# Altium schematic sheet HMS.SIM.A7677S.SchDoc
size A2
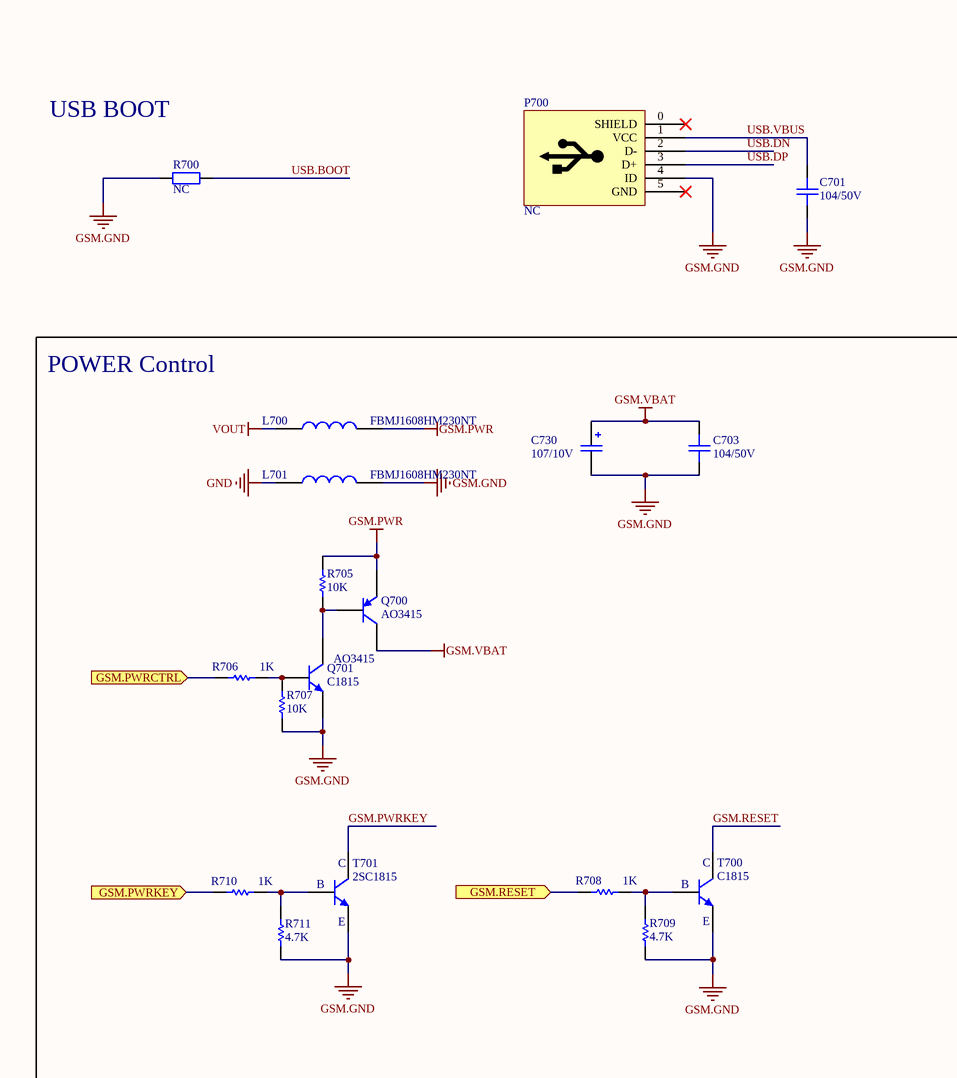
[diagram p0: HMS.SIM.A7677S.SchDoc, left]
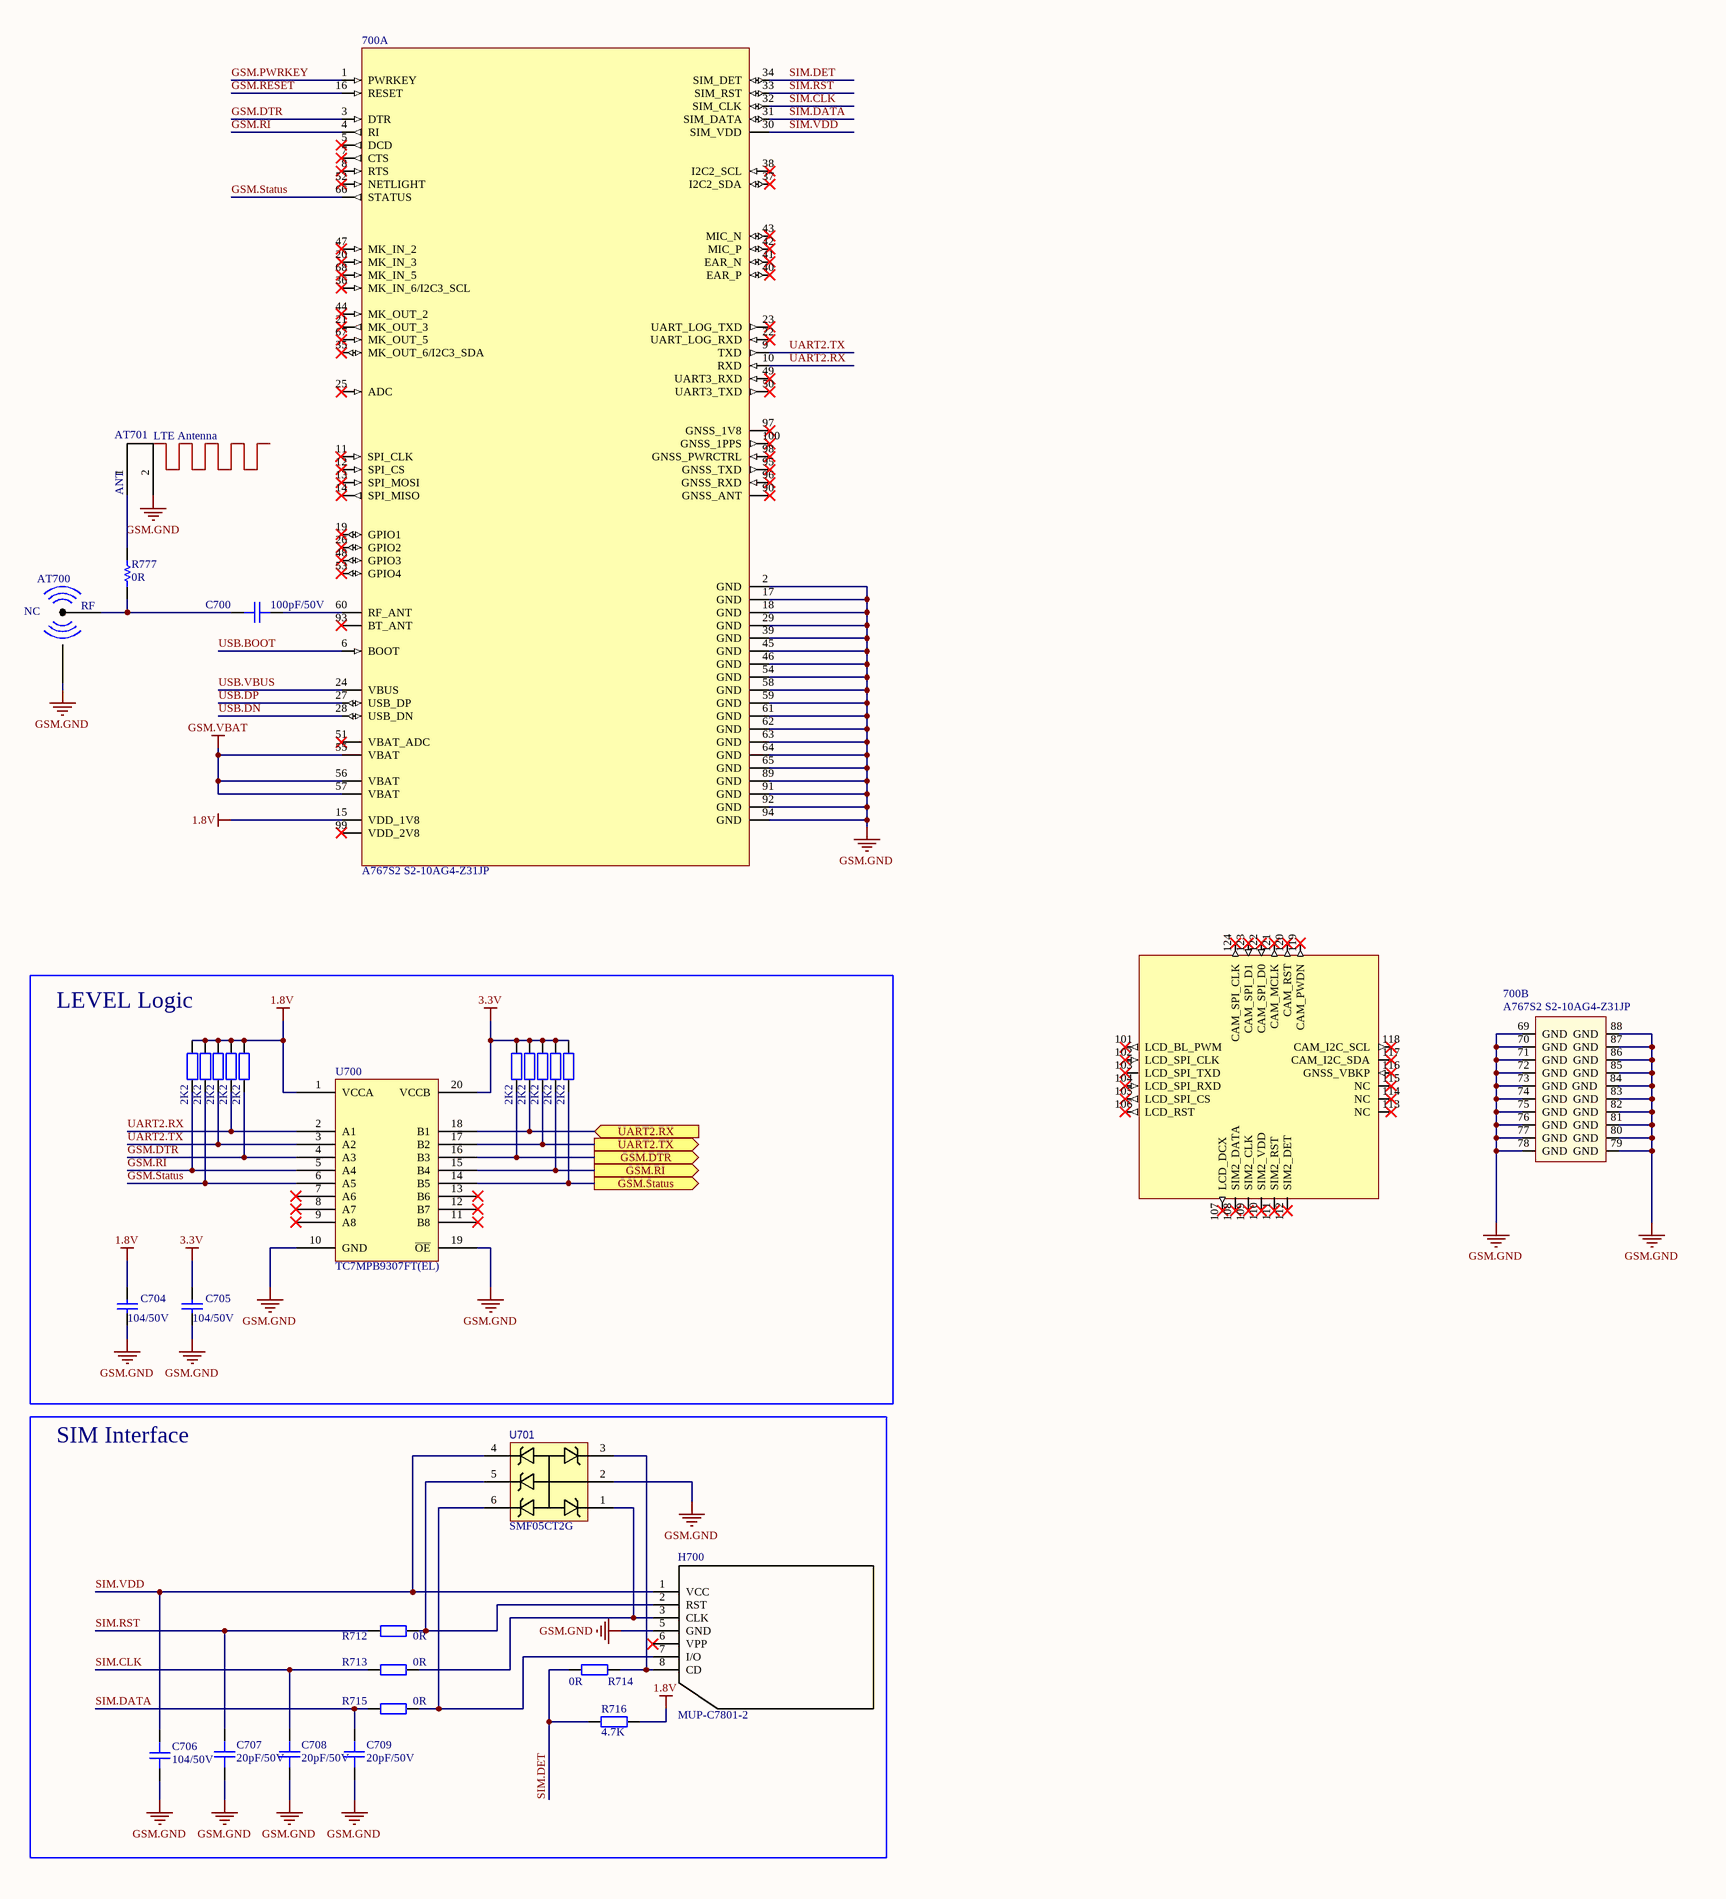
[diagram p1: HMS.SIM.A7677S.SchDoc, right]

## Parts
700  A767S2 S2-10AG4-Z31JP  [SIM_A7672]  (parts A,B of 2)
AT700  NC  [IPEX SMD]
AT701  LTE Antenna  [Antenna LTE/4G PCB]
C700  100pF/50V  [CAP_CERAMIC_0402(1005)]
C701  104/50V  [CAP_CERAMIC_0402(1005)]
C703  104/50V  [CAP_CERAMIC_0402(1005)]
C704  104/50V  [CAP_CERAMIC_0402(1005)]
C705  104/50V  [CAP_CERAMIC_0402(1005)]
C706  104/50V  [CAP_CERAMIC_0402(1005)]
C707  20pF/50V  [CAP_CERAMIC_0402(1005)]
C708  20pF/50V  [CAP_CERAMIC_0402(1005)]
C709  20pF/50V  [CAP_CERAMIC_0402(1005)]
C730  107/10V  [CAP_TANTAL_2312(6032-28)]
H700  MUP-C7801-2  [MUP-C7801]
L700  FBMJ1608HM230NT  [Inductor_0603]
L701  FBMJ1608HM230NT  [Inductor_0603]
P700  NC  [HDR1X4]
Q700  AO3415  [SOT23-3]
Q701  C1815  [SOT23-3]
R700  NC  [RES_0402(1005)]
R701  2K2  [RES_0402(1005)]
R702  2K2  [RES_0402(1005)]
R703  2K2  [RES_0402(1005)]
R704  2K2  [RES_0402(1005)]
R705  10K  [RES_0402(1005)]
R706  1K  [RES_0402(1005)]
R707  10K  [RES_0402(1005)]
R708  1K  [RES_0402(1005)]
R709  4.7K  [RES_0402(1005)]
R710  1K  [RES_0402(1005)]
R711  4.7K  [RES_0402(1005)]
R712  0R  [RES_0402(1005)]
R713  0R  [RES_0402(1005)]
R714  0R  [RES_0402(1005)]
R715  0R  [RES_0402(1005)]
R716  4.7K  [RES_0402(1005)]
R717  2K2  [RES_0402(1005)]
R718  2K2  [RES_0402(1005)]
R719  2K2  [RES_0402(1005)]
R720  2K2  [RES_0402(1005)]
R721  2K2  [RES_0402(1005)]
R722  2K2  [RES_0402(1005)]
R777  value 0R  [RES_0402(1005)]  (hidden comment: NC)
T700  C1815  [SOT23-3]
T701  2SC1815  [SOT23-3]
U700  TC7MPB9307FT(EL)  [TSOP65P640X120-20N]
U701  SMF05CT2G  [SOT65P210X140-6N]

## Blocks framed on the sheet
POWER Control: C703 C730 L700 L701 Q700 Q701 R705-R711 T700 T701
LEVEL Logic: C704 C705 R701-R704 R717-R722 U700
SIM Interface: C706-C709 H700 R712-R716 U701

## Ports
GSM.DTR (out), GSM.PWRCTRL (in), GSM.PWRKEY (in), GSM.RESET (in), GSM.RI (out), GSM.Status (out), UART2.RX (in), UART2.TX (out)

## Nets
1.8V: 700.15(VDD_1V8) C704.2 R701.2 R702.2 R716.2 R717.2 R718.2 R719.2 U700.1(VCCA)
3.3V: C705.2 R703.2 R704.2 R720.2 R721.2 R722.2 U700.20(VCCB)
GND: L701.1
GSM.GND: 700.2(GND) 700.17(GND) 700.18(GND) 700.29(GND) 700.39(GND) 700.45(GND) 700.46(GND) 700.54(GND) 700.58(GND) 700.59(GND) 700.61(GND) 700.62(GND) 700.63(GND) 700.64(GND) 700.65(GND) 700.69(GND) 700.70(GND) 700.71(GND) 700.72(GND) 700.73(GND) 700.74(GND) 700.75(GND) 700.76(GND) 700.77(GND) 700.78(GND) 700.79(GND) 700.80(GND) 700.81(GND) 700.82(GND) 700.83(GND) 700.84(GND) 700.85(GND) 700.86(GND) 700.87(GND) 700.88(GND) 700.89(GND) 700.91(GND) 700.92(GND) 700.94(GND) AT700.2 AT701.2 C701.2 C703.1 C704.1 C705.1 C706.1 C707.1 C708.1 C709.1 C730.2 H700.5(GND) L701.2 P700.4(ID) Q701.2(E) R700.1 R707.1 R709.2 R711.2 T700.2 T701.2 U700.10(GND) U700.19(~{OE}) U701.2(AN)
GSM.PWR: L700.2 Q700.2(E) R705.2
GSM.VBAT: 700.55(VBAT) 700.56(VBAT) 700.57(VBAT) C703.2 C730.1 Q700.3(C)
VOUT: L700.1
GSM.DTR: 700.3(DTR) R719.1 U700.4(A3)
GSM.DTR: R720.1 U700.16(B3) ; port GSM.DTR  [a separate net that carries the same name]
GSM.PWRCTRL: R706.2 ; port GSM.PWRCTRL
GSM.PWRKEY: 700.1(PWRKEY) T701.3
GSM.PWRKEY: R710.2 ; port GSM.PWRKEY  [a separate net that carries the same name]
GSM.RESET: 700.16(RESET) T700.3
GSM.RESET: R708.2 ; port GSM.RESET  [a separate net that carries the same name]
GSM.RI: 700.4(RI) R717.1 U700.5(A4)
GSM.RI: R721.1 U700.15(B4) ; port GSM.RI  [a separate net that carries the same name]
GSM.Status: 700.66(STATUS) R718.1 U700.6(A5)
GSM.Status: R722.1 U700.14(B5) ; port GSM.Status  [a separate net that carries the same name]
SIM.CLK: 700.32(SIM_CLK) C708.2 R713.1
SIM.DATA: 700.31(SIM_DATA) C709.2 R715.1
SIM.DET: 700.34(SIM_DET) R714.1 R716.1
SIM.RST: 700.33(SIM_RST) C707.2 R712.1
SIM.VDD: 700.30(SIM_VDD) C706.2 H700.1(VCC) U701.4(CT3)
UART2.RX: 700.10(RXD) R702.1 U700.2(A1)
UART2.RX: R703.1 U700.18(B1) ; port UART2.RX  [a separate net that carries the same name]
UART2.TX: 700.9(TXD) R701.1 U700.3(A2)
UART2.TX: R704.1 U700.17(B2) ; port UART2.TX  [a separate net that carries the same name]
USB.BOOT: 700.6(BOOT) R700.2
USB.DN: 700.28(USB_DN) P700.2(D-)
USB.DP: 700.27(USB_DP) P700.3(D+)
USB.VBUS: 700.24(VBUS) C701.1 P700.1(VCC)
Net700_60: 700.60(RF_ANT) C700.2
NetAT700_1: AT700.1 C700.1 R777.2
NetAT701_1: AT701.1 R777.1
NetH700_2: H700.2(RST) R712.2 U701.5(CT4)
NetH700_3: H700.3(CLK) R713.2 U701.1(CT1)
NetH700_7: H700.7(I/O) R715.2 U701.6(CT5)
NetH700_8: H700.8(CD) R714.2 U701.3(CT2)
NetQ700_1: Q700.1(B) Q701.3(C) R705.1
NetQ701_1: Q701.1(B) R706.1 R707.2
NetR708_1: R708.1 R709.1 T700.1
NetR710_1: R710.1 R711.1 T701.1

Not connected (* = marked no-connect by the designer): 700 5(DCD)* 7(CTS)* 8(RTS)* 11(SPI_CLK)* 12(SPI_CS)* 13(SPI_MOSI)* 14(SPI_MISO)* 19(GPIO1)* 20(MK_IN_3)* 21(MK_OUT_3)* 22(UART_LOG_RXD)* 23(UART_LOG_TXD)* 25(ADC)* 26(GPIO2)* 35(MK_OUT_6/I2C3_SDA)* 36(MK_IN_6/I2C3_SCL)* 37(I2C2_SDA)* 38(I2C2_SCL)* 40(EAR_P)* 41(EAR_N)* 42(MIC_P)* 43(MIC_N)* 44(MK_OUT_2)* 47(MK_IN_2)* 48(GPIO3)* 49(UART3_RXD)* 50(UART3_TXD)* 51(VBAT_ADC)* 52(NETLIGHT)* 53(GPIO4)* 67(MK_OUT_5)* 68(MK_IN_5)* 90(GNSS_ANT)* 93(BT_ANT)* 95(GNSS_TXD)* 96(GNSS_RXD)* 97(GNSS_1V8)* 98(GNSS_PWRCTRL)* 99(VDD_2V8)* 100(GNSS_1PPS)* 101(LCD_BL_PWM)* 102(LCD_SPI_CLK)* 103(LCD_SPI_TXD)* 104(LCD_SPI_RXD)* 105(LCD_SPI_CS)* 106(LCD_RST)* 107(LCD_DCX)* 108(SIM2_DATA)* 109(SIM2_CLK)* 110(SIM2_VDD)* 111(SIM2_RST)* 112(SIM2_DET)* 113(NC)* 114(NC)* 115(NC)* 116(GNSS_VBKP)* 117(CAM_I2C_SDA)* 118(CAM_I2C_SCL)* 119(CAM_PWDN)* 120(CAM_RST)* 121(CAM_MCLK)* 122(CAM_SPI_D0)* 123(CAM_SPI_D1)* 124(CAM_SPI_CLK)*; H700 6(VPP)*; P700 0(SHIELD)* 5(GND)*; U700 7(A6)* 8(A7)* 9(A8)* 11(B8)* 12(B7)* 13(B6)*

## Notes on the sheet
- USB BOOT
- (in symbol 2SC1815-HF) C; B; E
- (in symbol Antenna GSM/LTE PCB) ANT
- (in symbol IPEX-AT) RF

## Library data of the parts
700 = SIM_A7672: MPN: A767S2 S2-10AG4-Z31JP; Value: A767S2 S2-10AG4-Z31JP
AT700 = IPEX-AT: IPEX SMD; MPN: U.FL-R-SMT-1(80); Value: NC
AT701 = Antenna GSM/LTE PCB: MPN: NC; Value: LTE Antenna
C700 = CC0402FRNPO9BN101: CAP CER 100PF 50V C0G/NPO 0402; MPN: CC0402JRNPO9BN101; MFR: YAGEO; Category: Ceramic Capacitors; Value: 100pF/50V
C701 C706 = CC0603KPX7R9BB104: CAP CER 0.1UF 50V X5R 0402; MPN: CC0402KRX5R9BB104; MFR: YAGEO; Value: 104/50V; Category: Ceramic Capacitors
C703 = C0603C104K5RACTU: Tụ Ceramic 104/50V 10% 0603; MPN: CC0603KPX7R9BB104; MFR: YAGEO; CompanyID: VT-00982; Solder: SMT; Value: 104/50V; Category: Ceramic Capacitors
C704 C705 = Cap: CAP CER 0.1UF 50V X5R 0402; MFR: YAGEO; MPN: CC0402KRX5R9BB104; Published: 8-Jun-2000; LatestRevisionDate: 17-Jul-2002; LatestRevisionNote: Re-released for DXP Platform.; PackageReference: RAD-0.3; Publisher: Altium Limited; Value: 104/50V; Category: Ceramic Capacitors
C707-C709 = CC0402GRNPO9BN200: CAP CER 20PF 50V C0G/NPO 0402; MFR: YAGEO; Value: 20pF/50V; Category: Ceramic Capacitors; MPN: CC0402GRNPO9BN200
C730 = Cap Tantal 2312 (6032-28): Capacitor Tantalum 100uF/10V 2312(6032-28); MPN: TPSC107K010R0100; Value: 107/10V
H700 = MUP-C7801: Nano Sim card Socket; MFR: OEM; MPN: MUP-C7801-2; Value: MUP-C7801-2
L700 L701 = CBC2012T470M: INDUCTOR 200nH 20% 0805 SMD; MFR: Taiyo Yuden; Current Rating: 150mA; Current - Saturation: 120mA; Shielding: Unshielded; DC Resistance (DCR): 7.54 Ohm Max; Frequency - Self Resonant: 11MHz; Frequency - Test: 2.52MHz; Supplier 1: Digi-Key; RoHS: RoHS Compliant; Category: Inductors, Coils, Chokes; Stock 1: 108934; Pricing 1: 1=0.2, 10=0.188, 50=0.1762, 100=0.1645, 500=0.12926, 1000=0.10575 (USD); Packaging: Cut Tape (CT); Type: -; Inductance: 200nH; Tolerance: ±20%; Material - Core: -; Q @ Freq: -; Operating Temperature: -40°C ~ 105°C; Package / Case: 0805 (2012 Metric); Size / Dimension: 0.079" L x 0.049" W x 0.049" H (2.00mm x 1.25mm x 1.25mm); Mounting Type: Surface Mount; ComponentLink1URL: http://www.yuden.co.jp/ut/product/category/inductor/CBC2012T470M.pdf; ComponentLink1Description: http://www.yuden.co.jp/ut/product/category/inductor/CBC2012T470M.pdf; Supplier Part Number 1: 587-1605-1-ND; Value: FBMJ1608HM230NT; MPN: FBMJ1608HM230NT
P700 = USB-M: Value1: NC
Q700 = 2N3906: Mosfet P Channel; MFR: Alpha & Omega Semiconductor Inc.; Published: 8-Jun-2000; LatestRevisionDate: 15-Jan-2003; LatestRevisionNote: PCB Footprint 'BCY-W3/D4.7' replaced; DatasheetVersion: 1997; PackageVersion: Sep-1998; PackageReference: TO-92A; Publisher: Altium Limited; PackageDescription: TO, Flat Index; 3 In-Line, Axial Leads; Body Dia. 4.5mm; Leads 0.51 x 0.48 mm (max); ComponentLink1Description: Manufacturer Link; ComponentLink1URL: http://www.fairchildsemi.com/; ComponentLink2Description: Datasheet; ComponentLink2URL: http://www.fairchildsemi.com/ds/2N%2F2N3906.pdf; Category: Transistors - FETs, MOSFETs - Single; MPN: AO3415; Value: AO3415
Q701 = 2N3904: Trans C1815 NPN 0.15A/50V SMD SOT23; MFR: LinhKienChatLuong; MPN: 2SC1815; Published: 8-Jun-2000; LatestRevisionDate: 15-Jan-2003; LatestRevisionNote: PCB Footprint 'BCY-W3/D4.7' replaced; DatasheetVersion: 1997; PackageVersion: Sep-1998; PackageReference: TO-92A; Publisher: Altium Limited; PackageDescription: TO, Flat Index; 3 In-Line, Axial Leads; Body Dia. 4.5mm; Leads 0.51 x 0.48 mm (max); ComponentLink1Description: Manufacturer Link; ComponentLink1URL: http://www.fairchildsemi.com/; ComponentLink2Description: Datasheet; ComponentLink2URL: http://www.fairchildsemi.com/ds/2N%2F2N3904.pdf; Category: Transistor NPN; Value: C1815
R700 = RT0603BRD071KL: MPN: RC0402FR-131KL; MFR: YAGEO; Value: NC; Category: Chip Resistor - Surface Mount
R701-R704 R717-R722 = RC0402JR-072K2L: RES 2.2K OHM 1/8W 0402; MFR: YAGEO; Value: 2K2; MPN: RC0402JR-072K2L; Category: Chip Resistor - Surface Mount
R705 R707 = Res1: RES 10K OHM 5% 1/8W 0402; MPN: RC0402JR-0710KL; Published: 8-Jun-2000; LatestRevisionDate: 17-Jul-2002; LatestRevisionNote: Re-released for DXP Platform.; PackageReference: AXIAL-0.3; Publisher: Altium Limited; Value: 10K
R706 R710 = Res1: RES 1K OHM 1% 1/8W 0402; MFR: YAGEO; MPN: RC0402FR-071KL; Published: 8-Jun-2000; LatestRevisionDate: 17-Jul-2002; LatestRevisionNote: Re-released for DXP Platform.; PackageReference: AXIAL-0.3; Publisher: Altium Limited; PackageDescription: Axial Device, Thru-Hole; 2 Leads; 0.3 in Pin Spacing; Value: 1K; Category: Chip Resistor - Surface Mount
R708 = Res1: Trở 1K 1/8W 1% 0603; MPN: RC0402FR-071KL; MFR: YAGEO; Published: 8-Jun-2000; LatestRevisionDate: 17-Jul-2002; LatestRevisionNote: Re-released for DXP Platform.; PackageReference: AXIAL-0.3; Publisher: Altium Limited; PackageDescription: Axial Device, Thru-Hole; 2 Leads; 0.3 in Pin Spacing; Value: 1K; Category: Chip Resistor - Surface Mount
R709 = Res1: RES 4.7K 1% 1/8W 0402; MFR: YAGEO; MPN: RC0603JR-074K7L; Published: 8-Jun-2000; LatestRevisionDate: 17-Jul-2002; LatestRevisionNote: Re-released for DXP Platform.; PackageReference: AXIAL-0.3; Publisher: Altium Limited; PackageDescription: Axial Device, Thru-Hole; 2 Leads; 0.3 in Pin Spacing; Value: 4.7K; Category: Chip Resistor - Surface Mount
R711 = Res1: RES 4.7K 1% 1/8W 0402; MFR: YAGEO; MPN: RC0402FR-074K7L; Published: 8-Jun-2000; LatestRevisionDate: 17-Jul-2002; LatestRevisionNote: Re-released for DXP Platform.; PackageReference: AXIAL-0.3; Publisher: Altium Limited; PackageDescription: Axial Device, Thru-Hole; 2 Leads; 0.3 in Pin Spacing; Value: 4.7K; Category: Chip Resistor - Surface Mount
R712-R715 = RC0402FR-070RL: RES 0 OHM JUMPER 1/16W 0402; MFR: YAGEO; MPN: RC0402FR-070RL; Category: Chip Resistor - Surface Mount; Value: 0R
R716 = RC0402JR-074K7P: RES SMD 4.7K OHM 5% 1/16W 0402; MFR: YAGEO; Category: Chip Resistor - Surface Mount; MPN: RC0402JR-074K7P; Value: 4.7K
R777 = Res1: Trở 10K 1/8W 1% 0603; MFR: YAGEO; MPN: RT0603DRD0710KL; Published: 8-Jun-2000; LatestRevisionDate: 17-Jul-2002; LatestRevisionNote: Re-released for DXP Platform.; PackageReference: AXIAL-0.3; Publisher: Altium Limited; PackageDescription: Axial Device, Thru-Hole; 2 Leads; 0.3 in Pin Spacing; Category: Chip Resistor - Surface Mount; Value1: NC
T700 = 2SC1815-HF: Trans C1815 NPN 0.15A/50V SMD SOT23; MFR: LinhKienChatLuong; Parameter 2: Transistor NPN; MPN: 2SC1815; Value: C1815
T701 = 2SC1815-HF: Trans C1815 NPN 0.15A/50V SMD SOT23; MFR: LinhKienChatLuong; Value: 2SC1815; Category: Transistor NPN; MPN: 2SC1815
U700 = TC7MPB9307FK: IC Logic Convert 1.8V 3.3V 20-VSSOP; Manufacturer: Texas Instruments; Logic Function: Translator, Bidirectional; Number of Bits: 8; Data Rate: 100Mbps; Number of Outputs/Channel: 1; Differential - Input:Output: No/No; Propagation Delay (Max): 4ns; Voltage - Supply: 1.2 V ~ 3.6 V, 1.65 V ~ 5.5 V; Supplier 1: Digi-Key; MPN: TC7MPB9307FT(EL); RoHS: RoHS Compliant; Category: Integrated Circuits (ICs); Stock 1: 18000; Pricing 1: 2000=0.9 (USD); Packaging: Tape & Reel (TR); Input Type: Logic; Output Type: Logic; Number of Channels: 8; Operating Temperature: -40°C ~ 85°C; Package / Case: 20-TSSOP (0.173", 4.40mm Width); Supplier Device Package: 20-TSSOP; Mounting Type: Surface Mount; ComponentLink1URL: http://www.ti.com/lit/ds/symlink/txb0108.pdf; ComponentLink1Description: http://www.ti.com/lit/ds/symlink/txb0108.pdf; Supplier Part Number 1: 296-21527-2-ND; Value: TC7MPB9307FT(EL)
U701 = SMF05C: TVS Diode Array For ESD and Latch-Up Protection; Manufacturer: ON SEMICONDUCTOR; TVS Polarity: Unidirectional; Reverse Stand-Off Voltage Vrwm: 13; Breakdown Voltage Min: 6.2; Breakdown Voltage Max: 7.2; Clamping Voltage Vc Max: 21.5; Peak Pulse Current Ippm: 8; No. of Pins: 6; Supplier 1: Newark; MPN: SMF05CT2G; RoHS: YES; Stock 1: 0; Pricing 1: 6000=0.102, 15000=0.093, 30000=0.087, 75000=0.078, 150000=0.075 (USD); ComponentLink1URL: http://www.onsemi.com/pub/Collateral/SMF05C-D.PDF; ComponentLink1Description: http://www.onsemi.com/pub/Collateral/SMF05C-D.PDF; Supplier Part Number 1: 45J2265; Value: SMF05CT2G